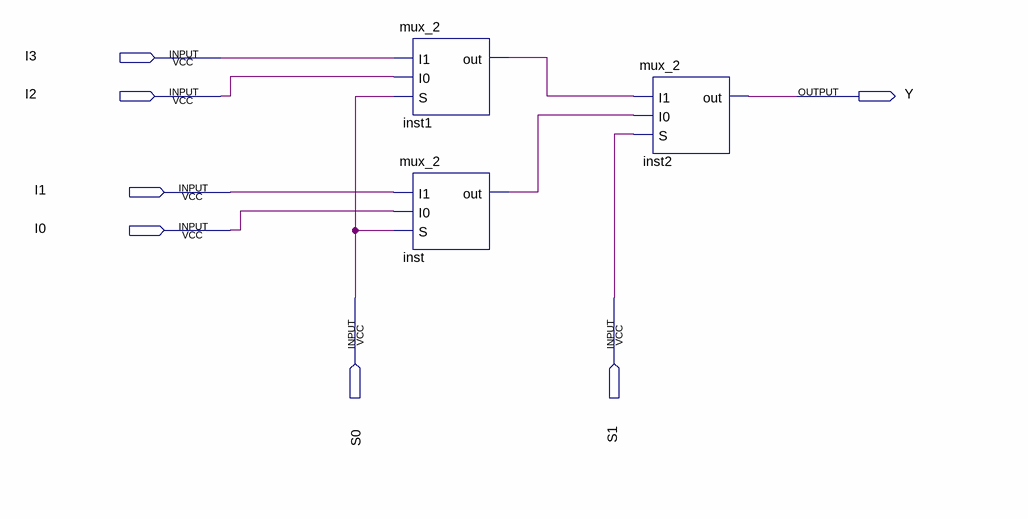
[diagram p0: schematic sheet]
// Quartus schematic Mux_4_to_1.bdf as structural Verilog: 3 symbols, 7 pins
module Mux_4_to_1 (
  input  I3,
  input  I2,
  input  I1,
  input  I0,
  input  S0,
  input  S1,
  output Y
);

  wire inst1_out, inst_out;

  mux_2 inst1 (.I1(I3), .I0(I2), .S(S0), .out(inst1_out));
  mux_2 inst (.I1(I1), .I0(I0), .S(S0), .out(inst_out));
  mux_2 inst2 (.I1(inst1_out), .I0(inst_out), .S(S1), .out(Y));
endmodule
